# Altium schematic sheet 1.DSP.SchDoc
size A3; Date: 2019/03/06; Author: ZhangPan; Revision: 2.0; SheetNumber: 1; SheetTotal: 4; Size: A4; Contact: 0731-88731029
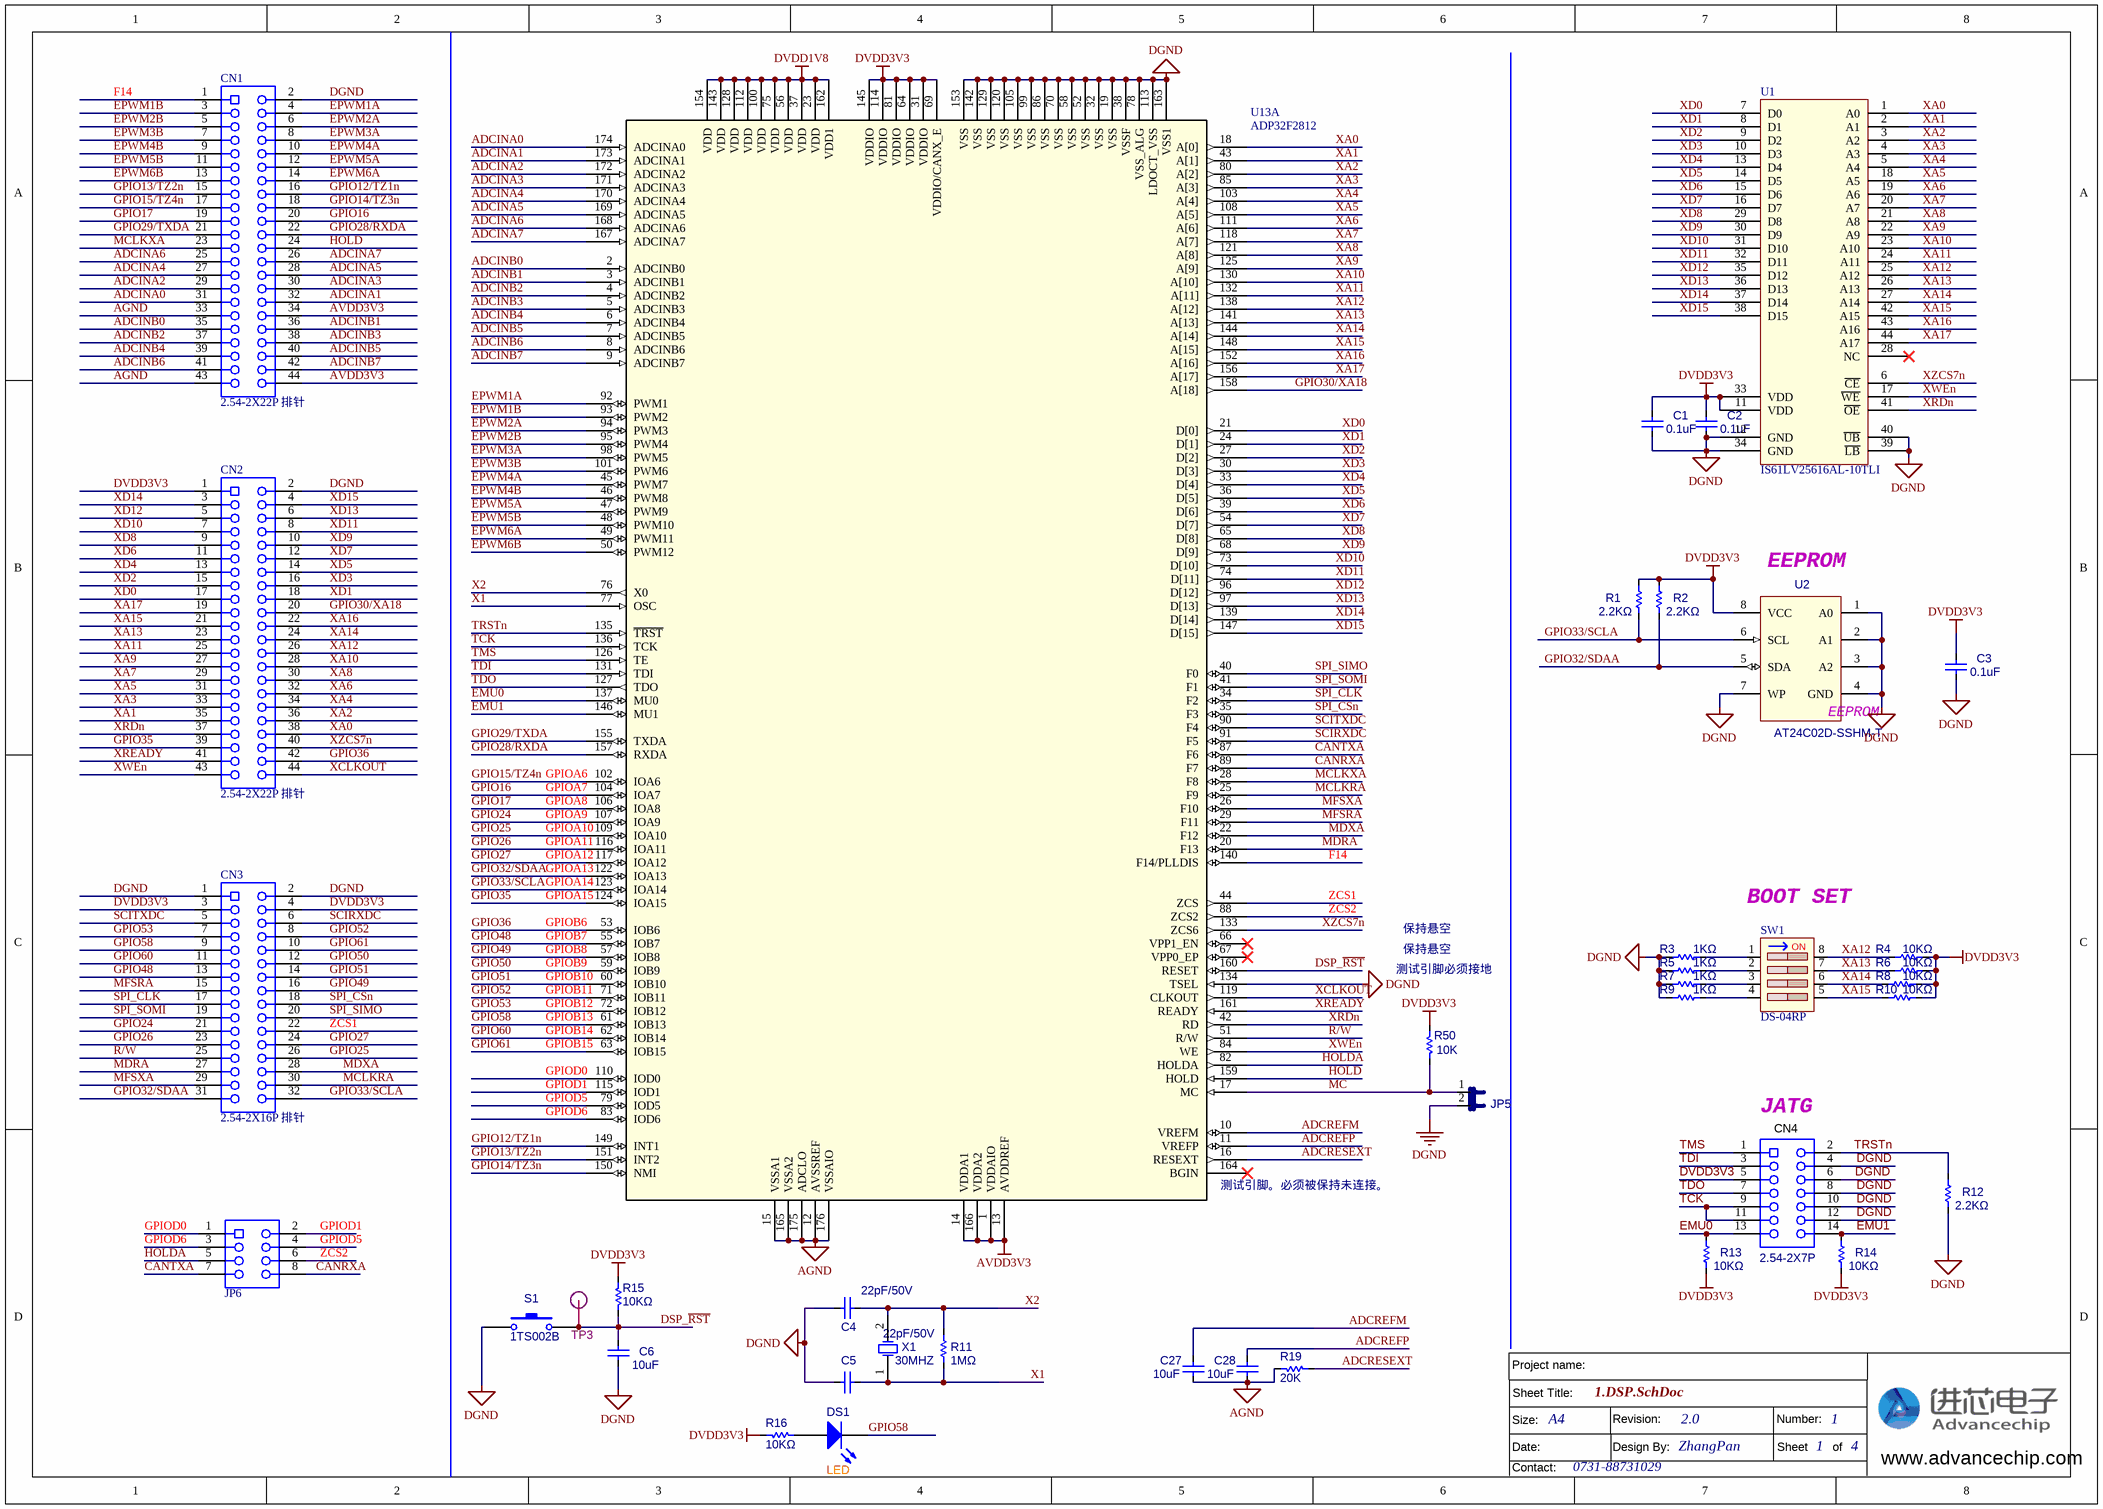
[diagram p0: 1.DSP.SchDoc]

## Parts
C1  value 0.1uF  [C0603]  (hidden comment: 0.1uF/50V)
C2  value 0.1uF  [C0603]  (hidden comment: 0.1uF/50V)
C3  value 0.1uF  [C0603]  (hidden comment: 0.1uF/50V)
C4  22pF/50V  [C0603 - duplicate]
C5  22pF/50V  [C0603]
C6  value 10uF  [C0805]  (hidden comment: 0.1uF/50V)
C27  value 10uF  [C0603 - duplicate]  (hidden comment: 2.2uF/25V)
C28  value 10uF  [C0603 - duplicate]  (hidden comment: 2.2uF/25V)
CN1  2.54-2X22P 排针  [IDC2X22]
CN2  2.54-2X22P 排针  [IDC2X22]
CN3  2.54-2X16P 排针  [IDC2X16]
CN4  value 2.54-2X7P  [IDC14-L]  (hidden comment: 2.54-2X7P 简易牛角母座)
DS1  LED  [SMD_LED0805_LED]
JP5  XH2.54-2P  [SIP2C]  (value not drawn)
JP6  2.54-2X7P 简易牛角母座  [HDR-TH_8P-P2.54-V-F-R2-C4-S2.54]  (value not drawn)
R1  2.2KΩ  [R0603]
R2  2.2KΩ  [R0603]
R3  1KΩ  [R0603]
R4  10KΩ  [R0603 - duplicate]
R5  1KΩ  [R0603]
R6  10KΩ  [R0603]
R7  1KΩ  [R0603]
R8  10KΩ  [R0603]
R9  1KΩ  [R0603]
R10  10KΩ  [R0603]
R11  1MΩ  [R0603]
R12  2.2KΩ  [R0603]
R13  10KΩ  [R0603]
R14  10KΩ  [R0603]
R15  10KΩ  [R0603]
R16  10KΩ  [R0603]
R19  20K  [R0603 - duplicate]
R50  10K  [R0603]
S1  value 1TS002B  [SW-3X6]  (hidden comment: 1TS002B-2400-5001-CT)
SW1  DS-04RP  [DIP-KEY-4]
TP3  RST  [TEST-0.8/1.5MM]  (value not drawn)
U1  IS61LV25616AL-10TLI  [TSOP-44_L18.4-W10.2-P0.80-LS11.8-BL]
U2  AT24C02D-SSHM-T  [SO-8]
U13  ADP32F2812  [AVP32F335]  (part A of 2)
X1  value 30MHZ  [XTAL_5032]  (hidden comment: YSX530GA 10MHZ 20pF 10ppm)

## Nets
AGND: C27.2 C28.2 CN1.33 CN1.43 R19.1 U13.12(AVSSREF) U13.15(VSSA1) U13.165(VSSA2) U13.175(ADCLO) U13.176(VSSAIO)
AVDD3V3: CN1.34 CN1.44 U13.1(VDDAIO) U13.13(AVDDREF) U13.14(VDDA1) U13.166(VDDA2)
DGND: C1.2 C2.2 C3.2 C4.2 C5.1 C6.2 CN1.2 CN2.2 CN3.1 CN3.2 CN4.4 CN4.6 CN4.8 CN4.10 CN4.12 JP5.2 R3.1 R5.1 R7.1 R9.1 R12.1 S1.2 U1.12(GND) U1.34(GND) U1.39(~{LB}) U1.40(~{UB}) U2.1(A0) U2.2(A1) U2.3(A2) U2.4(GND) U2.7(WP) U13.19(VSS) U13.32(VSS) U13.38(VSSF) U13.52(VSS) U13.58(VSS) U13.70(VSS) U13.78(VSS_ALG) U13.86(VSS) U13.99(VSS) U13.105(VSS) U13.113(LDOCT_VSS) U13.120(VSS) U13.129(VSS) U13.134(TSEL) U13.142(VSS) U13.153(VSS) U13.163(VSS1)
DVDD1V8: U13.23(VDD) U13.37(VDD) U13.56(VDD) U13.75(VDD) U13.100(VDD) U13.112(VDD) U13.128(VDD) U13.143(VDD) U13.154(VDD) U13.162(VDD1)
DVDD3V3: C1.1 C2.1 C3.1 CN2.1 CN3.3 CN3.4 CN4.5 R1.2 R2.2 R4.2 R6.2 R8.2 R10.2 R13.1 R14.1 R15.1 R16.1 R50.1 U1.11(VDD) U1.33(VDD) U2.8(VCC) U13.31(VDDIO) U13.64(VDDIO) U13.69(VDDIO/CANX_E) U13.81(VDDIO) U13.114(VDDIO) U13.145(VDDIO)
ADCINA0: CN1.31 U13.174(ADCINA0)
ADCINA1: CN1.32 U13.173(ADCINA1)
ADCINA2: CN1.29 U13.172(ADCINA2)
ADCINA3: CN1.30 U13.171(ADCINA3)
ADCINA4: CN1.27 U13.170(ADCINA4)
ADCINA5: CN1.28 U13.169(ADCINA5)
ADCINA6: CN1.25 U13.168(ADCINA6)
ADCINA7: CN1.26 U13.167(ADCINA7)
ADCINB0: CN1.35 U13.2(ADCINB0)
ADCINB1: CN1.36 U13.3(ADCINB1)
ADCINB2: CN1.37 U13.4(ADCINB2)
ADCINB3: CN1.38 U13.5(ADCINB3)
ADCINB4: CN1.39 U13.6(ADCINB4)
ADCINB5: CN1.40 U13.7(ADCINB5)
ADCINB6: CN1.41 U13.8(ADCINB6)
ADCINB7: CN1.42 U13.9(ADCINB7)
ADCREFM: C27.1 U13.10(VREFM)
ADCREFP: C28.1 U13.11(VREFP)
ADCRESEXT: R19.2 U13.16(RESEXT)
CANRXA: JP6.8 U13.89(F7)
CANTXA: JP6.7 U13.87(F6)
DSP_~{RST}: C6.1 R15.2 S1.1 TP3.1 U13.160(RESET)
EMU0: CN4.13 R13.2 U13.137(MU0)
EMU1: CN4.14 R14.2 U13.146(MU1)
EPWM1A: CN1.4 U13.92(PWM1)
EPWM1B: CN1.3 U13.93(PWM2)
EPWM2A: CN1.6 U13.94(PWM3)
EPWM2B: CN1.5 U13.95(PWM4)
EPWM3A: CN1.8 U13.98(PWM5)
EPWM3B: CN1.7 U13.101(PWM6)
EPWM4A: CN1.10 U13.45(PWM7)
EPWM4B: CN1.9 U13.46(PWM8)
EPWM5A: CN1.12 U13.47(PWM9)
EPWM5B: CN1.11 U13.48(PWM10)
EPWM6A: CN1.14 U13.49(PWM11)
EPWM6B: CN1.13 U13.50(PWM12)
F14: CN1.1 U13.140(F14/PLLDIS)
GPIO12/TZ1n: CN1.16 U13.149(INT1)
GPIO13/TZ2n: CN1.15 U13.151(INT2)
GPIO14/TZ3n: CN1.18 U13.150(NMI)
GPIO15/TZ4n: CN1.17 U13.102(IOA6)  [also labelled GPIOA6]
GPIO16: CN1.20 U13.104(IOA7)  [also labelled GPIOA7]
GPIO17: CN1.19 U13.106(IOA8)  [also labelled GPIOA8]
GPIO24: CN3.21 U13.107(IOA9)  [also labelled GPIOA9]
GPIO25: CN3.26 U13.109(IOA10)  [also labelled GPIOA10]
GPIO26: CN3.23 U13.116(IOA11)  [also labelled GPIOA11]
GPIO27: CN3.24 U13.117(IOA12)  [also labelled GPIOA12]
GPIO28/RXDA: CN1.22 U13.157(RXDA)
GPIO29/TXDA: CN1.21 U13.155(TXDA)
GPIO30/XA18: CN2.20 U13.158(A[18])
GPIO32/SDAA: CN3.31 R2.1 U2.5(SDA) U13.122(IOA13)  [also labelled GPIOA13]
GPIO33/SCLA: CN3.32 R1.1 U2.6(SCL) U13.123(IOA14)  [also labelled GPIOA14]
GPIO35: CN2.39 U13.124(IOA15)  [also labelled GPIOA15]
GPIO36: CN2.42 U13.53(IOB6)  [also labelled GPIOB6]
GPIO48: CN3.13 U13.55(IOB7)  [also labelled GPIOB7]
GPIO49: CN3.16 U13.57(IOB8)  [also labelled GPIOB8]
GPIO50: CN3.12 U13.59(IOB9)  [also labelled GPIOB9]
GPIO51: CN3.14 U13.60(IOB10)  [also labelled GPIOB10]
GPIO52: CN3.8 U13.71(IOB11)  [also labelled GPIOB11]
GPIO53: CN3.7 U13.72(IOB12)  [also labelled GPIOB12]
GPIO58: CN3.9 DS1.2(K) U13.61(IOB13)  [also labelled GPIOB13]
GPIO60: CN3.11 U13.62(IOB14)  [also labelled GPIOB14]
GPIO61: CN3.10 U13.63(IOB15)  [also labelled GPIOB15]
GPIOD0: JP6.1 U13.110(IOD0)
GPIOD1: JP6.2 U13.115(IOD1)
GPIOD5: JP6.4 U13.79(IOD5)
GPIOD6: JP6.3 U13.83(IOD6)
HOLD: CN1.24 U13.159(HOLD)
HOLDA: JP6.5 U13.82(HOLDA)
MC: JP5.1 R50.2 U13.17(MC)
MCLKRA: CN3.30 U13.25(F9)
MCLKXA: CN1.23 U13.28(F8)
MDRA: CN3.27 U13.20(F13)
MDXA: CN3.28 U13.22(F12)
MFSRA: CN3.15 U13.29(F11)
MFSXA: CN3.29 U13.26(F10)
R/W: CN3.25 U13.51(R/W)
SCIRXDC: CN3.6 U13.91(F5)
SCITXDC: CN3.5 U13.90(F4)
SPI_CLK: CN3.17 U13.34(F2)
SPI_CSn: CN3.18 U13.35(F3)
SPI_SIMO: CN3.20 U13.40(F0)
SPI_SOMI: CN3.19 U13.41(F1)
TCK: CN4.9 CN4.11 U13.136(TCK)
TDI: CN4.3 U13.131(TDI)
TDO: CN4.7 U13.127(TDO)
TMS: CN4.1 U13.126(TE)
TRSTn: CN4.2 R12.2 U13.135(~{TRST})
X1: C5.2 R11.2 U13.77(OSC) X1.1(OSC1)
X2: C4.1 R11.1 U13.76(X0) X1.2(OSC2)
XA0: CN2.38 U1.1(A0) U13.18(A[0])
XA1: CN2.35 U1.2(A1) U13.43(A[1])
XA2: CN2.36 U1.3(A2) U13.80(A[2])
XA3: CN2.33 U1.4(A3) U13.85(A[3])
XA4: CN2.34 U1.5(A4) U13.103(A[4])
XA5: CN2.31 U1.18(A5) U13.108(A[5])
XA6: CN2.32 U1.19(A6) U13.111(A[6])
XA7: CN2.29 U1.20(A7) U13.118(A[7])
XA8: CN2.30 U1.21(A8) U13.121(A[8])
XA9: CN2.27 U1.22(A9) U13.125(A[9])
XA10: CN2.28 U1.23(A10) U13.130(A[10])
XA11: CN2.25 U1.24(A11) U13.132(A[11])
XA12: CN2.26 R4.1 SW1.8 U1.25(A12) U13.138(A[12])
XA13: CN2.23 R6.1 SW1.7 U1.26(A13) U13.141(A[13])
XA14: CN2.24 R8.1 SW1.6 U1.27(A14) U13.144(A[14])
XA15: CN2.21 R10.1 SW1.5 U1.42(A15) U13.148(A[15])
XA16: CN2.22 U1.43(A16) U13.152(A[16])
XA17: CN2.19 U1.44(A17) U13.156(A[17])
XCLKOUT: CN2.44 U13.119(CLKOUT)
XD0: CN2.17 U1.7(D0) U13.21(D[0])
XD1: CN2.18 U1.8(D1) U13.24(D[1])
XD2: CN2.15 U1.9(D2) U13.27(D[2])
XD3: CN2.16 U1.10(D3) U13.30(D[3])
XD4: CN2.13 U1.13(D4) U13.33(D[4])
XD5: CN2.14 U1.14(D5) U13.36(D[5])
XD6: CN2.11 U1.15(D6) U13.39(D[6])
XD7: CN2.12 U1.16(D7) U13.54(D[7])
XD8: CN2.9 U1.29(D8) U13.65(D[8])
XD9: CN2.10 U1.30(D9) U13.68(D[9])
XD10: CN2.7 U1.31(D10) U13.73(D[10])
XD11: CN2.8 U1.32(D11) U13.74(D[11])
XD12: CN2.5 U1.35(D12) U13.96(D[12])
XD13: CN2.6 U1.36(D13) U13.97(D[13])
XD14: CN2.3 U1.37(D14) U13.139(D[14])
XD15: CN2.4 U1.38(D15) U13.147(D[15])
XRDn: CN2.37 U1.41(~{OE}) U13.42(RD)
XREADY: CN2.41 U13.161(READY)
XWEn: CN2.43 U1.17(~{WE}) U13.84(WE)
XZCS7n: CN2.40 U1.6(~{CE}) U13.133(ZCS6)
ZCS1: CN3.22 U13.44(ZCS)
ZCS2: JP6.6 U13.88(ZCS2)
NetDS1_1: DS1.1(A) R16.2
NetR3_2: R3.2 SW1.1
NetR5_2: R5.2 SW1.2
NetR7_2: R7.2 SW1.3
NetR9_2: R9.2 SW1.4

Not connected (* = marked no-connect by the designer): U1 28(NC)*; U13 66(VPP1_EN)* 67(VPP0_EP)* 164(BGIN)*

## Notes on the sheet
- (near U2) EEPROM
- BOOT SET
- 测试引脚必须接地
- 保持悬空
- (near CN4) JATG
- (near U13) 测试引脚。必须被保持未连接。
- Sheet Title:
- Project name:
- Size:
- Date:
- Contact:
- Revision:
- Design By:
- Number:
- Sheet       of
- www.advancechip.com
- (in symbol AT24C02C) EEPROM
- (in symbol SW-4B) ON

## Library data of the parts
C1-C3 C6 C27 C28 = Cap: 贴片电容; Published: 8-Jun-2000; LatestRevisionDate: 17-Jul-2002; LatestRevisionNote: Re-released for DXP Platform.; Publisher: Altium Limited
C4 C5 = Cap: COG贴片电容; Value: 100pF; Published: 8-Jun-2000; LatestRevisionDate: 17-Jul-2002; LatestRevisionNote: Re-released for DXP Platform.; Publisher: Altium Limited
CN1 CN2 = CON 22X2A: 连接器
CN3 = CON 16X2A: 连接器
CN4 JP6 = Receptacle_7X2: 连接器
DS1 = LED0: 发光二极管; Published: 8-Jun-2000; LatestRevisionDate: 08-Jul-2005; LatestRevisionNote: Mech Layer 1 removed.; PackageReference: LED-0; Publisher: Altium Limited; PackageDescription: LED; 2 Leads
JP5 = JP2: 连接器+跳线帽
R1-R16 R19 = Res: 贴片电阻; Value: 1K; Published: 8-Jun-2000; LatestRevisionDate: 17-Jul-2002; LatestRevisionNote: Re-released for DXP Platform.; Publisher: Altium Limited
R50 = Res: 贴片电阻; Published: 8-Jun-2000; LatestRevisionDate: 17-Jul-2002; LatestRevisionNote: Re-released for DXP Platform.; Publisher: Altium Limited
S1 = SW-PB: 鸿源精密轻触开关3X6; Published: 24-Mar-1999; LatestRevisionDate: 17-Jul-2002; LatestRevisionNote: Re-released for DXP Platform.; Publisher: Altium Limited
SW1 = SW-4B: 红色2PIN-2.54mm立式直插正拨拨码开关; Published: 24-Mar-1999; LatestRevisionDate: 17-Jul-2002; LatestRevisionNote: Re-released for DXP Platform.; Publisher: Altium Limited
TP3 = TP: 测试点
U1 = IS61LV25616AL-10TLI: 无锡中微LED驱动芯片
U2 = AT24C02C: EEPROM存储器
U13 = ADP32F2812: Mfr_Name: Texas Instruments; RefDes: RefDes; Type: Type
X1 = XTAL: 5032贴片无源晶振; Published: 8-Jun-2000; LatestRevisionDate: 17-Jul-2002; LatestRevisionNote: Re-released for DXP Platform.; Publisher: Altium Limited